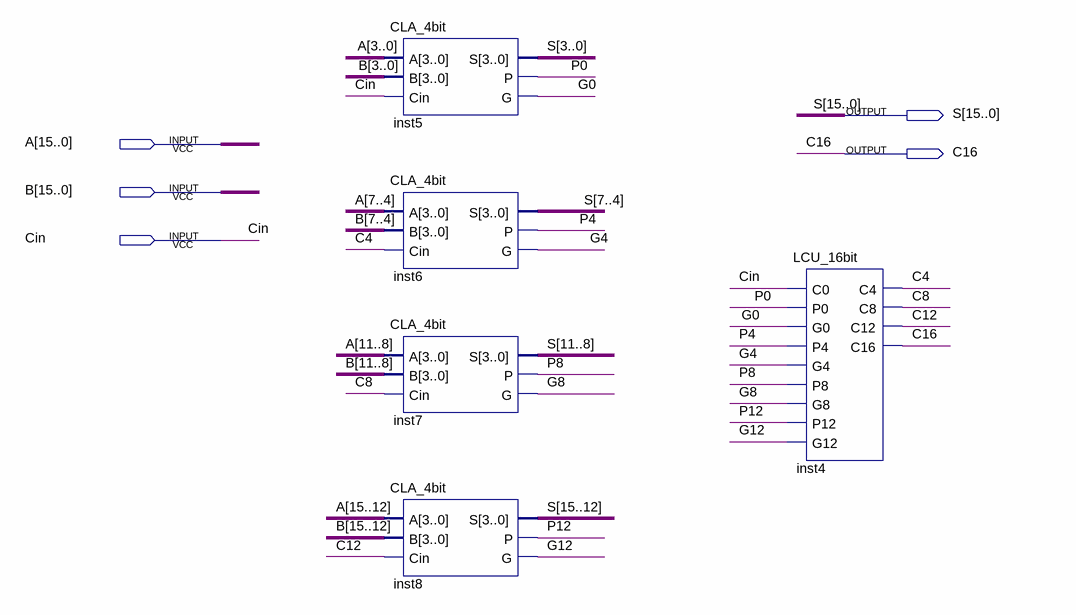
[diagram p0: schematic sheet]
// Quartus schematic CLA_16bit.bdf as structural Verilog: 5 symbols, 5 pins
module CLA_16bit (
  input  [15:0] A,
  input  [15:0] B,
  input  Cin,
  output [15:0] S,
  output C16
);

  wire C4, C8, C12, G0, G4, G8, G12, P0, P4, P8, P12;

  CLA_4bit inst5 (.A(A[3:0]), .B(B[3:0]), .Cin(Cin), .S(S[3:0]), .P(P0), .G(G0));
  CLA_4bit inst6 (.A(A[7:4]), .B(B[7:4]), .Cin(C4), .S(S[7:4]), .P(P4), .G(G4));
  CLA_4bit inst7 (.A(A[11:8]), .B(B[11:8]), .Cin(C8), .S(S[11:8]), .P(P8), .G(G8));
  CLA_4bit inst8 (.A(A[15:12]), .B(B[15:12]), .Cin(C12), .S(S[15:12]), .P(P12), .G(G12));
  LCU_16bit inst4 (
    .C0(Cin), .P0(P0), .G0(G0), .P4(P4), .G4(G4), .P8(P8), .G8(G8), .P12(P12), .G12(G12), .C4(C4), .C8(C8),
    .C12(C12), .C16(C16));
endmodule
